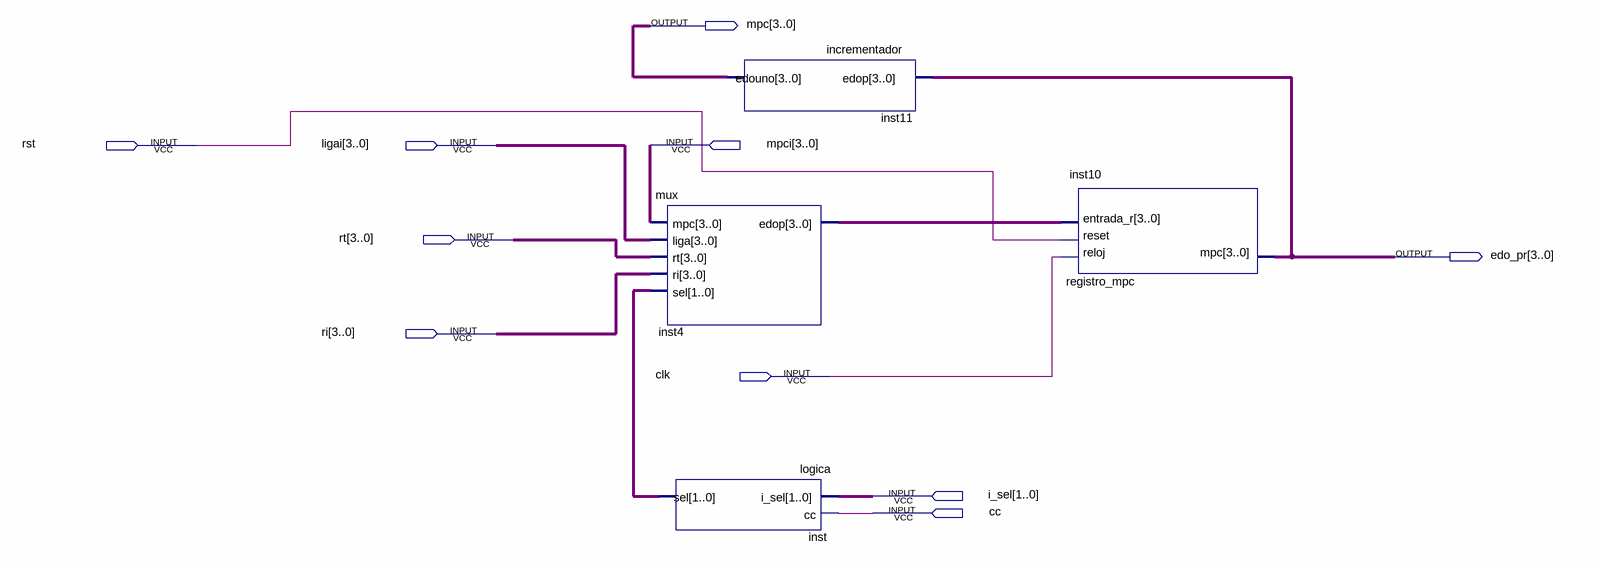
[diagram p0: schematic sheet]
// Quartus schematic secuenciador.bdf as structural Verilog: 4 symbols, 10 pins
module secuenciador (
  input  rst,
  input  [3:0] ligai,
  input  [3:0] mpci,
  input  [3:0] rt,
  input  [3:0] ri,
  input  clk,
  input  [1:0] i_sel,
  input  cc,
  output [3:0] mpc,
  output [3:0] edo_pr
);

  wire [1:0] inst_sel;
  wire [3:0] inst4_edop;

  mux inst4 (.mpc(mpci), .liga(ligai), .rt(rt), .ri(ri), .sel(inst_sel), .edop(inst4_edop));
  logica inst (.i_sel(i_sel), .cc(cc), .sel(inst_sel));
  incrementador inst11 (.edop(edo_pr), .edouno(mpc));
  registro_mpc inst10 (.reloj(clk), .reset(rst), .entrada_r(inst4_edop), .mpc(edo_pr));
endmodule
